# Altium schematic sheet Transmitter_Receiver_Section.SchDoc
size A; DocumentNumber: 4; SheetNumber: 4; SheetTotal: 4
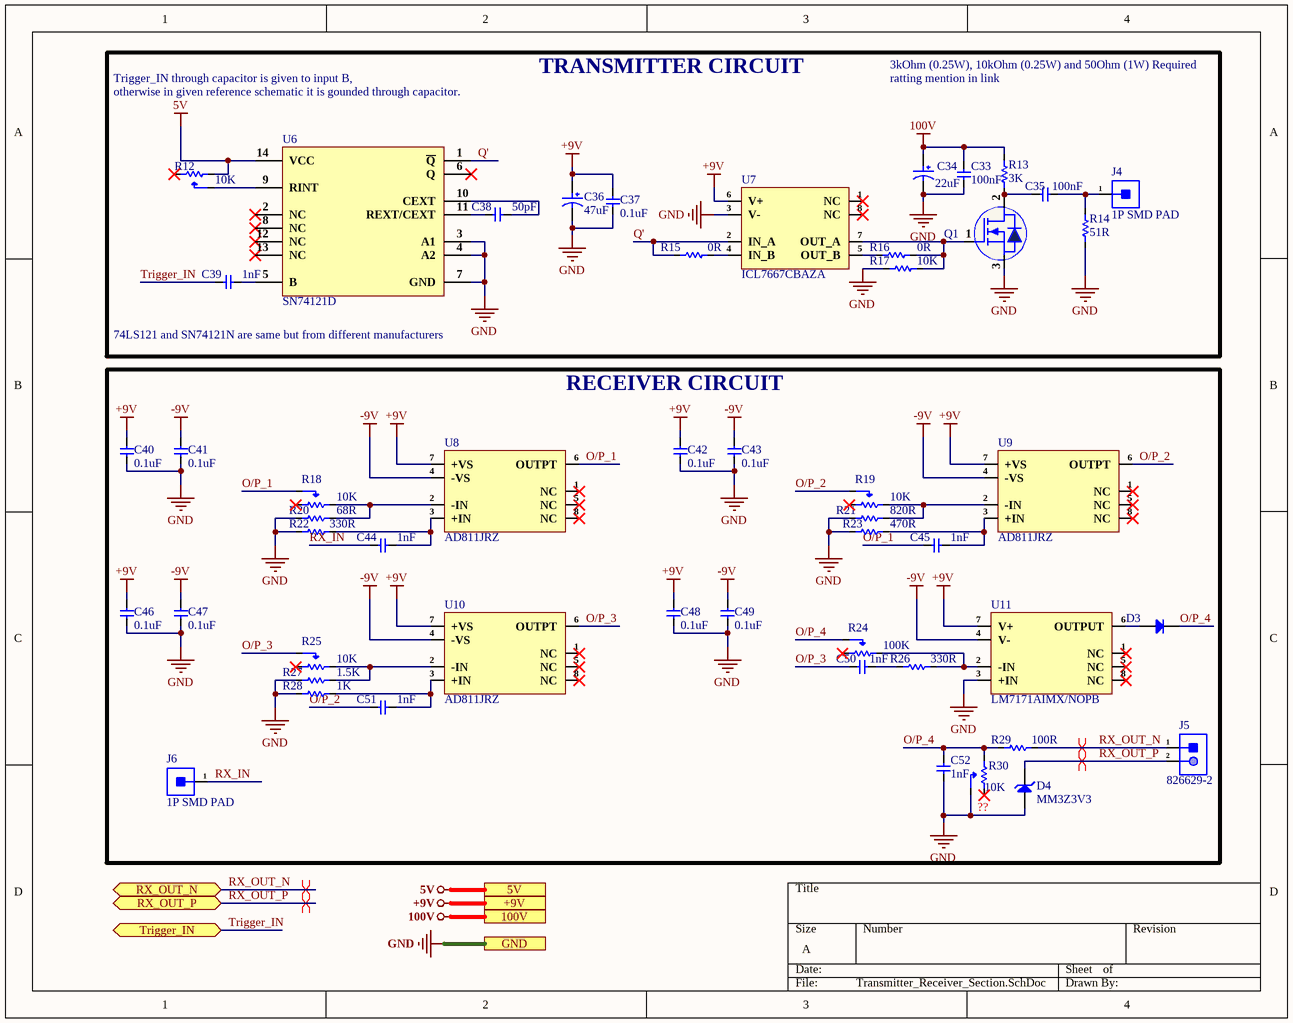
[diagram p0: Transmitter_Receiver_Section.SchDoc]

## Parts
C33  100nF  [Cap-0805]
C34  22uF  [VKMD1652D220MV]
C35  100nF  [Cap-0805]
C36  47uF  [Case-D]
C37  0.1uF  [CAP-0201]
C38  50pF  [Cap-0402]
C39  1nF  [CAP-0201]
C40  0.1uF  [CAP-0201]
C41  0.1uF  [CAP-0201]
C42  0.1uF  [CAP-0201]
C43  0.1uF  [CAP-0201]
C44  1nF  [CAP-0201]
C45  1nF  [CAP-0201]
C46  0.1uF  [CAP-0201]
C47  0.1uF  [CAP-0201]
C48  0.1uF  [CAP-0201]
C49  0.1uF  [CAP-0201]
C50  1nF  [CAP-0201]
C51  1nF  [CAP-0201]
C52  1nF  [CAP-0201]
D3  1N4148W  [SOD-123]  (value not drawn)
D4  MM3Z3V3  [SOD-323]
J4  1P SMD PAD  [1P SMD PAD]
J5  826629-2  [HDR1X2_]
J6  1P SMD PAD  [1P SMD PAD]
Q1  5N20A-252  [DPAK]  (value not drawn)
R12  10K  [TC33X-2-103E_]
R13  3K  [Res-0603]
R14  51R  [RES-2512]
R15  0R  [Res-0402]
R16  0R  [Res-0402]
R17  10K  [Res-0603]
R18  10K  [TC33X-2-103E_]
R19  10K  [TC33X-2-103E_]
R20  68R  [Res-0201]
R21  820R  [Res-0201]
R22  330R  [Res-0201]
R23  470R  [Res-0201]
R24  100K  [TC33X-2-104E_]
R25  10K  [TC33X-2-103E_]
R26  330R  [Res-0201]
R27  1.5K  [Res-0201]
R28  1K  [Res-0201]
R29  100R  [Res-0201]
R30  10K  [TC33X-2-103E_]
U6  SN74121D  [SOIC-14]
U7  ICL7667CBAZA  [SOIC-8(0.150", 3.80mm Width)]
U8  AD811JRZ  [SOIC-8(0.154", 3.90mm Width)]
U9  AD811JRZ  [SOIC-8(0.154", 3.90mm Width)]
U10  AD811JRZ  [SOIC-8(0.154", 3.90mm Width)]
U11  LM7171AIMX/NOPB  [SOIC-8(0.154", 3.90mm Width)]

## Blocks framed on the sheet
TRANSMITTER CIRCUIT: C33-C39 J4 Q1 R12-R17 U6 U7
RECEIVER CIRCUIT: C40-C52 D3 D4 J5 J6 R18-R30 U8-U11

## Ports
5V (see Top_sheet[3B], Controller_Section[4D], Power_Section[1D]), 100V (see Top_sheet[3B], Power_Section[1D]), +9V (see Top_sheet[3B], Power_Section[1D]), GND (see Top_sheet[4C], Controller_Section[4D], Power_Section[1D]), RX_OUT_N (bidir, see Top_sheet[3B], Controller_Section[3D]), RX_OUT_P (bidir, see Top_sheet[3B], Controller_Section[3D]), Trigger_IN (bidir, see Top_sheet[3C], Controller_Section[3D])

## Nets
5V: R12.1(CCW) U6.14(VCC) ; port 5V
100V: C33.2 C34.1 R13.2 ; port 100V
+9V: C36.1 C37.2 C40.2 C42.2 C46.2 C48.2 U7.6(V+) U8.7(+VS) U9.7(+VS) U10.7(+VS) U11.7(V+) ; port +9V
-9V: C41.2 C43.2 C47.2 C49.2 U8.4(-VS) U9.4(-VS) U10.4(-VS) U11.4(V-)
GND: C33.1 C34.2 C36.2 C37.1 C40.1 C41.1 C42.1 C43.1 C46.1 C47.1 C48.1 C49.1 C52.1 D4.2(A) Q1.3(S) R14.1 R17.1 R20.1 R21.1 R22.1 R23.1 R27.1 R28.1 R30.2(Wiper) U6.3(A1) U6.4(A2) U6.7(GND) U7.3(V-) U11.3(+IN) ; port GND
O/P_1: C45.1 R18.2(Wiper) U8.6(OUTPT)
O/P_2: C51.1 R19.2(Wiper) U9.6(OUTPT)
O/P_3: C50.1 R25.2(Wiper) U10.6(OUTPT)
O/P_4: C52.2 D3.2(K) R24.2(Wiper) R29.2 R30.3(CW)
Q': R15.1 U6.1(~{Q}) U7.2(IN_A)
RX_IN: C44.1 J6.1
RX_OUT_N: J5.1 R29.1 ; port RX_OUT_N
RX_OUT_P: D4.1(K) J5.2 ; port RX_OUT_P
Trigger_IN: C39.2 ; port Trigger_IN
NetC35_1: C35.1 J4.1 R14.2
NetC35_2: C35.2 Q1.2(D) R13.1
NetC38_1: C38.1 U6.11(REXT/CEXT)
NetC38_2: C38.2 U6.10(CEXT)
NetC39_1: C39.1 U6.5(B)
NetC44_2: C44.2 R22.2 U8.3(+IN)
NetC45_2: C45.2 R23.2 U9.3(+IN)
NetC50_2: C50.2 R26.1
NetC51_2: C51.2 R28.2 U10.3(+IN)
NetD3_1: D3.1(A) U11.6(OUTPUT)
NetQ1_1: Q1.1(G) R16.2 R17.2 U7.7(OUT_A)
NetR12_2: R12.2(Wiper) U6.9(RINT)
NetR15_2: R15.2 U7.4(IN_B)
NetR16_1: R16.1 U7.5(OUT_B)
NetR18_3: R18.3(CW) R20.2 U8.2(-IN)
NetR19_3: R19.3(CW) R21.2 U9.2(-IN)
NetR24_3: R24.3(CW) R26.2 U11.2(-IN)
NetR25_3: R25.3(CW) R27.2 U10.2(-IN)

Not connected (* = marked no-connect by the designer): R12 3(CW)*; R18 1(CCW)*; R19 1(CCW)*; R24 1(CCW)*; R25 1(CCW)*; R30 1(CCW)*; U6 2(NC)* 6(Q)* 8(NC)* 12(NC)* 13(NC)*; U7 1(NC)* 8(NC)*; U8 1(NC)* 5(NC)* 8(NC)*; U9 1(NC)* 5(NC)* 8(NC)*; U10 1(NC)* 5(NC)* 8(NC)*; U11 1(NC)* 5(NC)* 8(NC)*

## Layout directives
differential pair; differential pair class RX_OUT_Lines; net class RX_OUT; rule Matched Net Lengths [Tolerance = 50mil]; rule Impedance Constraint [Min = 85.00    Max = 90.00    ]: RX_OUT_N, RX_OUT_P

## Notes on the sheet
- Trigger_IN through capacitor is given to input B,
- otherwise in given reference schematic it is gounded through capacitor.
- 3kOhm (0.25W), 10kOhm (0.25W) and 50Ohm (1W) Required
- ratting mention in link
- 74LS121 and SN74121N are same but from different manufacturers
- (near R30) ??

## Library data of the parts
C33 C35 = FM21X104K201ECG: 200V 100nF X7R ±10% 0805 Multilayer Ceramic Capacitors MLCC - SMD/SMT ROHS; Manufacturer: PSA; Manufacturer Part Number: FM21X104K201ECG; Package: 0805; LCSC Part Number: C784084; Item Type: Capacitor; ComponentLink1Description: LCSC; ComponentLink1URL: https://www.lcsc.com/product-detail/Multilayer-Ceramic-Capacitors-MLCC-SMD-SMT_PSA-Prosperity-Dielectrics-FM21X104K201ECG_C784084.html
C34 = VKMD1652D220MV: 22uF 200V 320mA@100kHz ±20% SMD,D8xL16.5mm Aluminum Electrolytic Capacitors - SMD ROHS; Manufacturer: Ymin; Manufacturer Part Number: VKMD1652D220MV; Package: SMD,D8xL16.5mm; LCSC Part Number: C487500; Item Type: Electrolytic Capacitor; ComponentLink1Description: LCSC; ComponentLink1URL: https://www.lcsc.com/product-detail/Aluminum-Electrolytic-Capacitors-SMD_Ymin-VKMD1652D220MV_C487500.html
C36 = CA45-D025K476T: 47uF 25V 0.9Ω@100kHz ±10% CASE-D-7343 Tantalum Capacitors ROHS; Manufacturer: Hunan Xiangyee in S&T; Manufacturer Part Number: CA45-D025K476T; ComponentLink1URL: https://www.lcsc.com/product-detail/Tantalum-Capacitors_Hunan-Xiangyee-in-S-T-CA45-D025K476T_C123267.html; ComponentLink1Description: LCSC; LCSC Part Number: C123267; Item Type: Capacitor; Package: CASE-D-7343
C37 C40-C43 C46-C49 = GRM033R61E104KE14D: CAP CER 0.1UF 25V X5R 0201; Manufacturer: Murata; Material: 4241ConductorMaterial; Value: 100nF; Tolerance: 10%; Item Type: Capacitor; Supplier: Rs; Supplier Part Number: 1852066; Manufacturer Part Number: GRM033R61E104KE14D; RoHS: Yes; Category: Ceramic Capacitors; Stock: 14000; Pricing: 1000=0.008, 5000=0.007, 10000=0.006 (GBP); Mounting Technology: Surface Mount; Case/Package: 0201; Case Code (Metric): 0603; Case Code (Imperial): 0201; Weight: 1.2E-05oz; Min Operating Temperature: -55°C; Max Operating Temperature: 85°C; Packaging: Tape and Reel; Voltage Rating: 25V; Dielectric: X5R; Termination: SMD/SMT; Voltage Rating (DC): 25V; Package Quantity: 15000; Series: GRM; Length: 0.024inch; Width: 0.012inch; Height: 0.3mm; Thickness: 0.013inch; Lead Free: Lead Free; RoHS Compliant: Yes; ComponentLink1URL: http://www.farnell.com/datasheets/2867843.pdf?src-supplier=Farnell; ComponentLink1Description: http://www.farnell.com/datasheets/2867843.pdf?src-supplier=Farnell; ComponentLink2URL: http://www.mouser.com/ds/2/281/c02e-2905.pdf?src-supplier=Mouser; ComponentLink2Description: http://www.mouser.com/ds/2/281/c02e-2905.pdf?src-supplier=Mouser; ComponentLink3URL: https://datasheet.octopart.com/GRM033R61E104KE14D-Murata-datasheet-22122223.pdf?src-supplier=Future+Electronics; ComponentLink3Description: https://datasheet.octopart.com/GRM033R61E104KE14D-Murata-datasheet-22122223.pdf?src-supplier=Future+Electronics; ComponentLink4URL: http://www.farnell.com/datasheets/2867843.pdf?src-supplier=Element14; ComponentLink4Description: http://www.farnell.com/datasheets/2867843.pdf?src-supplier=Element14; ComponentLink5URL: http://search.murata.co.jp/Ceramy/image/img/A01X/G101/ENG/GRM033R61E104KE14-01.pdf?src-supplier=Digi-Key; ComponentLink5Description: http://search.murata.co.jp/Ceramy/image/img/A01X/G101/ENG/GRM033R61E104KE14-01.pdf?src-supplier=Digi-Key; ComponentLink6URL: http://www.farnell.com/datasheets/2867843.pdf?src-supplier=Newark; ComponentLink6Description: http://www.farnell.com/datasheets/2867843.pdf?src-supplier=Newark; ComponentLink7URL: https://datasheet.octopart.com/GRM033R61E104KE14D-Murata-datasheet-165579666.pdf?src-supplier=TME; ComponentLink7Description: https://datasheet.octopart.com/GRM033R61E104KE14D-Murata-datasheet-165579666.pdf?src-supplier=TME; LCSC Part Number: C76939
C38 = 0402CG500J500NT: 50V 50pF C0G ±5% 0402 Multilayer Ceramic Capacitors MLCC - SMD/SMT ROHS; Manufacturer: FH; LCSC Part Number: C501830; Manufacturer Part Number: 0402CG500J500NT; Item Type: Capacitor; ComponentLink1Description: LCSC; ComponentLink1URL: https://www.lcsc.com/product-detail/Multilayer-Ceramic-Capacitors-MLCC-SMD-SMT_FH-Guangdong-Fenghua-Advanced-Tech-0402CG500J500NT_C501830.html; Value: 50pF
C39 C44 C45 C50-C52 = 0201B102K500NT: 50V 1nF X7R ±10% 0201 Multilayer Ceramic Capacitors MLCC - SMD/SMT ROHS; Manufacturer: FH; LCSC Part Number: C66942; Manufacturer Part Number: 0201B102K500NT; Item Type: Capacitor; ComponentLink1Description: LCSC; ComponentLink1URL: https://www.lcsc.com/product-detail/Multilayer-Ceramic-Capacitors-MLCC-SMD-SMT_FH-Guangdong-Fenghua-Advanced-Tech-0201B102K500NT_C66942.html; Value: 1nF
D3 = 1N4148W: 100V 400mW Single 1.25V@150mA 8ns 300mA SOD-123 Switching Diode ROHS; Manufacturer: JSMSEMI; ComponentLink1Description: LCSC; ComponentLink1URL: https://www.lcsc.com/product-detail/Switching-Diode_JSMSEMI-1N4148W_C917030.html; Manufacturer Part Number: 1N4148W; Package: SOD-123; LCSC Part Number: C917030; Item Type: Diode
D4 = MM3Z3V3: ±5% Single 3.1V~3.5V 300mW 3.3V SOD-323 Zener Diodes ROHS; Manufacturer: JSMSEMI; Item Type: Diode; ComponentLink1Description: LCSC; ComponentLink1URL: https://www.lcsc.com/product-detail/Zener-Diodes_Shandong-Jingdao-Microelectronics-MM3Z3V3_C123917.html; Manufacturer Part Number: MM3Z3V3; Package: SOD-323; LCSC Part Number: C123917
J4 J6 = 1P SMD PAD: Wire Connecting Pad; Item Type: SMD Pad; Manufacturer Part Number: 1P SMD PAD
J5 = 826629-2: CONN HEADER VERT 2POS 2.54MM; Manufacturer: TE Connectivity; Manufacturer Part Number: 8266292; Number of Contacts: 2; Connector Type: Plug,Header,Pin; Current Rating: 3A; Board Standoff: No (Without); High Speed Serial Data Connector: No; PCB Mount Retention: Without; Gender: Male; PCB Mounting Orientation: Vertical; Contact Post Length: 0.1259inch; Plating Thickness: 0.8um; Item Type: Male Header; Supplier 1: RSComponents; RoHS: Yes; Category: Board to Board Connectors; Mount: Straddle Mount; Contact Plating: Gold,Tin; Contact Material: Bronze; Color: Green; Housing Color: Green; Housing Material: PBT; Contact Shape: Square; Min Operating Temperature: -65°C; Max Operating Temperature: 105°C; Number of Rows: 1; Termination: Through Hole; Number of Positions: 2; Packaging: Carton; Package Quantity: 3000; Series: AMPMODU MOD II; Contact Type: Male Pin; Contact Gender: Male; Orientation: Straight; Contact Protection: No (Without); Gasket: No (Without); High Temperature Housing: No; Keyed: No; Mating Alignment: No (Without); Mating Connector Lock: No (Without); Selectively Loaded: No (Without); Stabilizers: No (Without); Strain Relief: No (Without); Length: 5.08mm; Pitch: 2.54mm; Contact Mating Length: 6.7mm; Row Spacing: 2.54mm; Depth: 2.5mm; Radiation Hardening: No; Flammability Rating: UL94 V-0; REACH SVHC: No SVHC; ELV: Compliant; Lead Free: Lead Free; ComponentLink1URL: https://datasheet.ciiva.com/11746/0900766b80d7c358-11746248.pdf?src-supplier=RSComponents; ComponentLink1Description: https://datasheet.ciiva.com/11746/0900766b80d7c358-11746248.pdf?src-supplier=RSComponents; ComponentLink2URL: https://datasheet.ciiva.com/30224/8266292-30224019.pdf?src-supplier=Onlinecomponents.com; ComponentLink2Description: https://datasheet.ciiva.com/30224/8266292-30224019.pdf?src-supplier=Onlinecomponents.com; ComponentLink3URL: https://datasheet.ciiva.com/29369/001094754-da-01-en-stiftleiste-1-reihig-0-0826629-2-29369600.pdf?src-supplier=Conrad; ComponentLink3Description: https://datasheet.ciiva.com/29369/001094754-da-01-en-stiftleiste-1-reihig-0-0826629-2-29369600.pdf?src-supplier=Conrad; ComponentLink4URL: https://datasheet.ciiva.com/6857/eng-cd-826629-aa-basefilename-6857135.pdf?src-supplier=Digi-Key; ComponentLink4Description: https://datasheet.ciiva.com/6857/eng-cd-826629-aa-basefilename-6857135.pdf?src-supplier=Digi-Key; ComponentLink5URL: https://datasheet.ciiva.com/14120/eh826629-draw-14120837.pdf?src-supplier=Distrelec; ComponentLink5Description: https://datasheet.ciiva.com/14120/eh826629-draw-14120837.pdf?src-supplier=Distrelec; Supplier Part Number 1: 1361864; LCSC Part Number: C86471
Q1 = 5N20A-252: 200V 5A 78W 580mΩ@10V,2.5A 3V@250uA N Channel TO-252-2(DPAK) MOSFETs ROHS; Manufacturer: GOFRD; Item Type: Mosfet; Manufacturer Part Number: 5N20A-252; Package: TO-252-2(DPAK); LCSC Part Number: C224101; ComponentLink1Description: LCSC; ComponentLink1URL: https://www.lcsc.com/product-detail/MOSFETs_GOFORD-5N20A-252_C224101.html
R12 R18 R19 R25 R30 = TC33X-2-103E: TRIMMER 10K OHM 0.1W J LEAD TOP; Manufacturer: Bourns; Tolerance: 25%; Resistance: 10kR; Number of Turns: 1; Power Rating: 100mW; Temperature Coefficient: 250ppm/°C; Voltage Rating (DC): 50V; Item Type: Potentiometer; Supplier 1: Rs; Manufacturer Part Number: TC33X-2-103E; RoHS: Yes; Category: Variable Resistors and Potentiometers; Stock 1: 950; Pricing 1: 500=0.24400, 1000=0.22000, 2000=0.19700, 4000=0.17300 (GBP); Mount: Surface Mount; Color: Silver; Weight: 29.4mg; Contact Plating: Copper,Tin,Silver; Min Operating Temperature: -40°C; Max Operating Temperature: 100°C; Packaging: Tape and Reel; Package Quantity: 1; Resistor Type: Cermet; Termination: Foot Print; Taper: Linear; Max Power Dissipation: 100mW; Series: TC33; Resistance Tolerance: 25%; Length: 3mm; Width: 0.118inch; Height: 0.047inch; Depth: 3.8mm; Radiation Hardening: No; Reach SVHC Compliant: Yes; Military Standard: Not; Lead Free: Lead Free; RoHS Compliant: Yes; ComponentLink1URL: https://datasheet.ciiva.com/11830/0900766b802749b3-11830705.pdf?src-supplier=Rs; ComponentLink1Description: https://datasheet.ciiva.com/11830/0900766b802749b3-11830705.pdf?src-supplier=Rs; ComponentLink2URL: https://datasheet.ciiva.com/7953/1818686-7953349.pdf?src-supplier=Element14; ComponentLink2Description: https://datasheet.ciiva.com/7953/1818686-7953349.pdf?src-supplier=Element14; ComponentLink3URL: https://datasheet.ciiva.com/26944/getdatasheetpartid-183773-26944166.pdf?src-supplier=Verical; ComponentLink3Description: https://datasheet.ciiva.com/26944/getdatasheetpartid-183773-26944166.pdf?src-supplier=Verical; ComponentLink4URL: https://datasheet.ciiva.com/2155/tc33-2155962.pdf?src-supplier=Digi-Key; ComponentLink4Description: https://datasheet.ciiva.com/2155/tc33-2155962.pdf?src-supplier=Digi-Key; ComponentLink5URL: https://datasheet.ciiva.com/2155/tc33-2155963.pdf?src-supplier=Digi-Key; ComponentLink5Description: https://datasheet.ciiva.com/2155/tc33-2155963.pdf?src-supplier=Digi-Key; ComponentLink6URL: https://datasheet.ciiva.com/2155/tc33-2155964.pdf?src-supplier=Digi-Key; ComponentLink6Description: https://datasheet.ciiva.com/2155/tc33-2155964.pdf?src-supplier=Digi-Key; ComponentLink7URL: https://datasheet.ciiva.com/8089/tc33-8089484.pdf?src-supplier=Avnet; ComponentLink7Description: https://datasheet.ciiva.com/8089/tc33-8089484.pdf?src-supplier=Avnet; ComponentLink8URL: https://datasheet.ciiva.com/28659/1520225-28659212.pdf?src-supplier=Element14; ComponentLink8Description: https://datasheet.ciiva.com/28659/1520225-28659212.pdf?src-supplier=Element14; Supplier Part Number 1: 4617135P; LCSC part Number: C719176
R13 = CRCW06033K00FKEAHP: RES SMD 3K OHM 1% 1/3W 0603; Manufacturer: Vishay Intertech; Manufacturer Part Number: CRCW06033K00FKEAHP; Package: 0603; ComponentLink1Description: LCSC; ComponentLink1URL: https://www.lcsc.com/product-detail/Chip-Resistor-Surface-Mount_Vishay-Intertech-CRCW06033K00FKEAHP_C844164.html; Value: 3K; LCSC Part Number: C844164
R14 = RC2512JK-0751RL: 1W Thick Film Resistors 200V ±100ppm/℃ ±5% 51Ω 2512 Chip Resistor - Surface Mount ROHS; Manufacturer: YAGEO; Manufacturer Part Number: RC2512JK-0751RL; Package: 2512; LCSC Part Number: C136999; Item Type: Resistor; ComponentLink1Description: LCSC; ComponentLink1URL: https://www.lcsc.com/product-detail/Chip-Resistor-Surface-Mount_YAGEO-RC2512JK-0751RL_C136999.html
R15 R16 = AC0402FR-070RL: RESISTOR 0402 JUMPER ZERO OHM; Manufacturer: Yageo; Voltage Rating: 50V; Power Rating: 62.5mW; Tolerance: 1%; Temperature Coefficient: 200ppm/°C; Supplier: Digi-Key; Supplier Part Number: 13-AC0402FR-070RLDKR-ND; Manufacturer Part Number: AC0402FR-070RL; RoHS: Yes; Category: Chip SMD Resistors; Stock: 337140; Pricing: 1=0.1, 10=0.017, 25=0.0132, 50=0.01, 100=0.0071, 250=0.00568, 500=0.00454, 1000=0.00335, 5000=0.0024 (USD); Case/Package: 0402; Case Code (Imperial): 0402; Case Code (Metric): 1005; Min Operating Temperature: -55°C; Max Operating Temperature: 155°C; Value: 0R; Packaging: Tape and Reel; Termination: SMD/SMT; Series: AC; Height: 370um; ComponentLink1URL: https://datasheet.ciiva.com/12656/pyu-ac-51-rohs-l-2-12656734.pdf?src-supplier=Mouser; ComponentLink1Description: https://datasheet.ciiva.com/12656/pyu-ac-51-rohs-l-2-12656734.pdf?src-supplier=Mouser; Item Type: Resistor; ComponentLink2Description: LCSC; ComponentLink2URL: https://www.lcsc.com/product-detail/Chip-Resistor-Surface-Mount_YAGEO-AC0402FR-070RL_C226739.html; LCSC Part Number: C226739
R17 = ESR03EZPJ103: RES SMD 10K OHM 5% 1/4W 0603; Manufacturer: ROHM Semicon; Item Type: Resistor; Value: 10K; Package: 0603; ComponentLink1Description: LCSC; ComponentLink1URL: https://www.lcsc.com/product-detail/Chip-Resistor-Surface-Mount_ROHM-Semicon-ESR03EZPJ103_C253330.html; Manufacturer Part Number: ESR03EZPJ103; LCSC Part Number: C253330
R20 = 0201WMJ0680TEE: 50mW Thick Film Resistors ±5% ±200ppm/℃ 68Ω 0201 Chip Resistor - Surface Mount ROHS; Manufacturer: UNI-ROYAL; Manufacturer Part Number: 0201WMJ0680TEE; Footprint: 0201; ComponentLink1Description: LCSC; ComponentLink1URL: https://www.lcsc.com/product-detail/Chip-Resistor-Surface-Mount_UNI-ROYAL-Uniroyal-Elec-0201WMJ0680TEE_C473576.html; LCSC Part Number: C473576; Item Type: Resistor
R21 = WR02X821JAL: 50mW Thick Film Resistors ±200ppm/℃ ±5% 820Ω 0201 Chip Resistor - Surface Mount ROHS; Manufacturer: Walsin Tech Corp; Manufacturer Part Number: WR02X821JAL; Package: 0201; LCSC Part Number: C180347; Item Type: Resistor; ComponentLink1Description: LCSC; ComponentLink1URL: https://www.lcsc.com/product-detail/Chip-Resistor-Surface-Mount_Walsin-Tech-Corp-WR02X821JAL_C180347.html
R22 R26 = RC-01W3300FT: 50mW ±1% ±200ppm/℃ 330Ω 0201 Chip Resistor - Surface Mount ROHS; Manufacturer: FH; Manufacturer Part Number: RC-01W3300FT; Footprint: 0201; ComponentLink1Description: LCSC; ComponentLink1URL: https://www.lcsc.com/product-detail/Chip-Resistor-Surface-Mount_FH-Guangdong-Fenghua-Advanced-Tech-RC-01W3300FT_C320833.html; LCSC Part Number: C320833; Item Type: Resistor
R23 = RC-01W471JT: 50mW ±5% ±200ppm/℃ 470Ω 0201 Chip Resistor - Surface Mount ROHS; Manufacturer: FH; Manufacturer Part Number: RC-01W471JT; Package: 0201; LCSC Part Number: C304545; Item Type: Resistor; ComponentLink1Description: LCSC; ComponentLink1URL: https://www.lcsc.com/product-detail/Chip-Resistor-Surface-Mount_FH-Guangdong-Fenghua-Advanced-Tech-RC-01W471JT_C304545.html
R24 = TC33X-2-104E: TRIMMER 100K OHM 0.1W J LEAD TOP; Manufacturer: Bourns; Resistance: 100kR; Tolerance: 25%; Power Rating: 100mW; Number of Turns: 1; Temperature Coefficient: 250ppm/°C; Voltage Rating (DC): 50V; Item Type: Potentiometer; Supplier 1: Arrow Electronics; Manufacturer Part Number: TC33X-2-104E; RoHS: Yes; Category: Variable Resistors and Potentiometers; Stock 1: 12500; Pricing 1: 2500=0.15500, 5000=0.13130 (USD); Mount: Surface Mount; Color: Silver; Weight: 29.4mg; Min Operating Temperature: -40°C; Max Operating Temperature: 100°C; Packaging: Tape and Reel; Package Quantity: 2500; Resistor Type: Carbon,Cermet; Termination: Foot Print; Max Power Dissipation: 100mW; Series: TC33; Resistance Tolerance: 25%; Length: 3mm; Width: 0.118inch; Height: 0.047inch; Depth: 3.8mm; Radiation Hardening: No; REACH SVHC: No SVHC; Military Standard: Not; RoHS Compliant: Yes; ComponentLink1URL: https://datasheet.ciiva.com/11832/0900766b802749b3-11832506.pdf?src-supplier=RSComponents; ComponentLink1Description: https://datasheet.ciiva.com/11832/0900766b802749b3-11832506.pdf?src-supplier=RSComponents; ComponentLink2URL: https://datasheet.ciiva.com/8700/tc33-8700395.pdf?src-supplier=Avnet; ComponentLink2Description: https://datasheet.ciiva.com/8700/tc33-8700395.pdf?src-supplier=Avnet; ComponentLink3URL: https://datasheet.ciiva.com/2155/tc33-2155965.pdf?src-supplier=Digi-Key; ComponentLink3Description: https://datasheet.ciiva.com/2155/tc33-2155965.pdf?src-supplier=Digi-Key; ComponentLink4URL: https://datasheet.ciiva.com/7953/1818686-7953181.pdf?src-supplier=Element14; ComponentLink4Description: https://datasheet.ciiva.com/7953/1818686-7953181.pdf?src-supplier=Element14; ComponentLink5URL: https://datasheet.ciiva.com/16716/70155234-16716301.pdf?src-supplier=Allied+Electronics; ComponentLink5Description: https://datasheet.ciiva.com/16716/70155234-16716301.pdf?src-supplier=Allied+Electronics; ComponentLink6URL: https://datasheet.ciiva.com/2155/tc33-2155966.pdf?src-supplier=Digi-Key; ComponentLink6Description: https://datasheet.ciiva.com/2155/tc33-2155966.pdf?src-supplier=Digi-Key; ComponentLink7URL: https://datasheet.ciiva.com/7953/1818686-7953182.pdf?src-supplier=Element14; ComponentLink7Description: https://datasheet.ciiva.com/7953/1818686-7953182.pdf?src-supplier=Element14; ComponentLink8URL: https://datasheet.ciiva.com/2155/tc33-2155967.pdf?src-supplier=Digi-Key; ComponentLink8Description: https://datasheet.ciiva.com/2155/tc33-2155967.pdf?src-supplier=Digi-Key; Supplier Part Number 1: TC33X-2-104E; LCSC Part Number: C719186
R27 = RTT01152JTH: 50mW Thick Film Resistors ±5% ±200ppm/℃ 1.5kΩ 0201 Chip Resistor - Surface Mount ROHS; Manufacturer: RALEC; Manufacturer Part Number: RTT01152JTH; Package: 0201; LCSC Part Number: C102694; Item Type: Resistor; ComponentLink1Description: LCSC; ComponentLink1URL: https://www.lcsc.com/product-detail/Chip-Resistor-Surface-Mount_RALEC-RTT01152JTH_C102694.html
R28 = RC0201FR-071KL: RES 1K OHM 1% 1/20W 0201; Manufacturer: Yageo; Value: 1kR; Temperature Coefficient: 200ppm/°C; Power Rating: 50mW; Voltage Rating: 25V; Item Type: Resistor; Supplier: Digi-Key; Supplier Part Number: 311-1KMCT-ND; Manufacturer Part Number: RC0201FR-071KL; RoHS: Yes; Category: Chip SMD Resistors; Stock: 5606340; Pricing: 1=0.1, 10=0.027, 50=0.0172, 100=0.0143, 500=0.00988, 1000=0.00854, 5000=0.00629 (USD); Case/Package: 0201; Contact Plating: Tin,Matte; Case Code (Metric): 0603; Case Code (Imperial): 0201; Min Operating Temperature: -55°C; Max Operating Temperature: 125°C; Tolerance: 1%; Resistor Type: Thick Film; Package Quantity: 10000; Packaging: Tape and Reel; Number of Terminations: 2; Termination: SMD/SMT; Max Power Dissipation: 50mW; Working Voltage: 25V; Features: Moisture Resistant; Series: RC; Resistance Tolerance: 1%; Technology: THICK FILM; Construction: Rectangular; Voltage Rating (DC): 25V; Length: 0.024inch; Width: 0.012inch; Height: 0.01inch; Depth: 0.3mm; Military Standard: Not; RoHS Compliant: Yes; Reach SVHC Compliant: Unknown; Lead Free: 5697LeadFree; ComponentLink1URL: https://datasheet.ciiva.com/7672/1563626-7672204.pdf?src-supplier=Element14; ComponentLink1Description: https://datasheet.ciiva.com/7672/1563626-7672204.pdf?src-supplier=Element14; ComponentLink2URL: https://datasheet.ciiva.com/22698/1563626-22698505.pdf?src-supplier=Element14; ComponentLink2Description: https://datasheet.ciiva.com/22698/1563626-22698505.pdf?src-supplier=Element14; ComponentLink3URL: https://datasheet.ciiva.com/29721/pyu-r-int-thick-7-29721196.pdf?src-supplier=Digi-Key; ComponentLink3Description: https://datasheet.ciiva.com/29721/pyu-r-int-thick-7-29721196.pdf?src-supplier=Digi-Key; ComponentLink4URL: https://datasheet.ciiva.com/29721/pyu-r-int-thick-7-29721195.pdf?src-supplier=Digi-Key; ComponentLink4Description: https://datasheet.ciiva.com/29721/pyu-r-int-thick-7-29721195.pdf?src-supplier=Digi-Key; ComponentLink5URL: https://datasheet.ciiva.com/8896/pyu-rc0201-51-rohs-l-8-8896174.pdf?src-supplier=Avnet; ComponentLink5Description: https://datasheet.ciiva.com/8896/pyu-rc0201-51-rohs-l-8-8896174.pdf?src-supplier=Avnet; LCSC Part Number: C138165
R29 = CR0201FH1000G: 50mW ±1% 100Ω 0201 Chip Resistor - Surface Mount ROHS; Manufacturer: LIZ ELEC; Manufacturer Part Number: CR0201FH1000G; Package: 0201; LCSC Part Number: C3036998; Item Type: Resistor; ComponentLink1Description: LCSC; ComponentLink1URL: https://www.lcsc.com/product-detail/Chip-Resistor-Surface-Mount_LIZ-Elec-CR0201FH1000G_C3036998.html
U6 = SN74121D: 45ns 4.75V~5.25V SOIC-14 Monostable Multivibrators ROHS; Manufacturer: Taxes Instrument; Item Type: IC; Manufacturer Part Number: SN74121D; Package: SOIC-14; LCSC Part Number: C1522774; ComponentLink1Description: LCSC; ComponentLink1URL: https://www.lcsc.com/product-detail/Monostable-Multivibrators_Texas-Instruments-SN74121D_C1522774.html
U7 = ICL7667CBAZA: MOSFET 4.5V~15V SOIC-8 Gate Drive ICs ROHS; Manufacturer: RENESAS; Item Type: IC; Manufacturer Part Number: ICL7667CBAZA; Package: SOIC-8; LCSC Part Number: C1549286; ComponentLink1Description: LCSC; ComponentLink1URL: https://www.lcsc.com/product-detail/Gate-Drive-ICs_RENESAS-ICL7667CBAZA_C1549286.html
U8-U10 = AD811JRZ: Video Amplifier, 1, 140 Mhz, 2500 V/ S, 0 C, 70 C, 100 Ma Rohs Compliant: Yes; Manufacturer: Analog Devices; Item Type: IC; Supplier: Mouser; Supplier Part Number: 584-AD811JRZ; Manufacturer Part Number: AD811JRZ; RoHS: Yes; Category: Amplifiers - Op Amps, Buffer, Instrumentation; Stock: 196; Pricing: 1=12.99, 10=11.94, 25=11.45, 50=11.45, 98=10.09, 100=10.09, 1000=8.97, 10000=8.97 (USD); ComponentLink1URL: https://datasheet.ciiva.com/1134/1610772-1134928.pdf?src-supplier=Element14; ComponentLink1Description: https://datasheet.ciiva.com/1134/1610772-1134928.pdf?src-supplier=Element14; ComponentLink2URL: https://datasheet.ciiva.com/15130/getdatasheetpartid-72911-15130233.pdf?src-supplier=Verical; ComponentLink2Description: https://datasheet.ciiva.com/15130/getdatasheetpartid-72911-15130233.pdf?src-supplier=Verical; ComponentLink3URL: https://datasheet.ciiva.com/1823/ad811-1823927.pdf?src-supplier=Digi-Key; ComponentLink3Description: https://datasheet.ciiva.com/1823/ad811-1823927.pdf?src-supplier=Digi-Key; ComponentLink4URL: https://datasheet.ciiva.com/2972/ad811-2972994.pdf?src-supplier=Avnet; ComponentLink4Description: https://datasheet.ciiva.com/2972/ad811-2972994.pdf?src-supplier=Avnet; LCSC Part Number: *
U11 = LM7171AIMX/NOPB: Very High Speed, High Output Current, Voltage Feedback Amplifier 8-SOIC -40 to 85; Manufacturer: TI National Semiconductor; Item Type: IC; Supplier: Mouser; Supplier Part Number: 926-LM7171AIMX/NOPB; Manufacturer Part Number: LM7171AIMX/NOPB; RoHS: Yes; Category: Amplifiers - Op Amps, Buffer, Instrumentation; Stock: 853; Pricing: 1=4.79, 10=4.22, 50=4.22, 100=3.58, 1000=2.61, 10000=2.51 (USD); ComponentLink1URL: https://datasheet.ciiva.com/6627/lm7171-6627136.pdf?src-supplier=Digi-Key; ComponentLink1Description: https://datasheet.ciiva.com/6627/lm7171-6627136.pdf?src-supplier=Digi-Key; ComponentLink2URL: https://datasheet.ciiva.com/6627/lm7171-6627103.pdf?src-supplier=Digi-Key; ComponentLink2Description: https://datasheet.ciiva.com/6627/lm7171-6627103.pdf?src-supplier=Digi-Key